# Altium schematic sheet Laser_System.SchDoc
size A4; Date: *******; ApprovedBy: *******; CheckedBy: None; Author: *******; CompanyName: *******; DrawnBy: Name; Engineer: *******; Organization: *******; Address1: *******; Address2: *******; Address3: *******; Address4: *******; DocumentNumber: Doc Num; Revision: *******; SheetNumber: 7; SheetTotal: 7; CurrentTime: *******; CurrentDate: *******; Time: *******; DocumentFullPathAndName: *******; DocumentName: *******; ModifiedDate: *******; ImagePath: *******; ProjectName: *******; Application_BuildNumber: *******
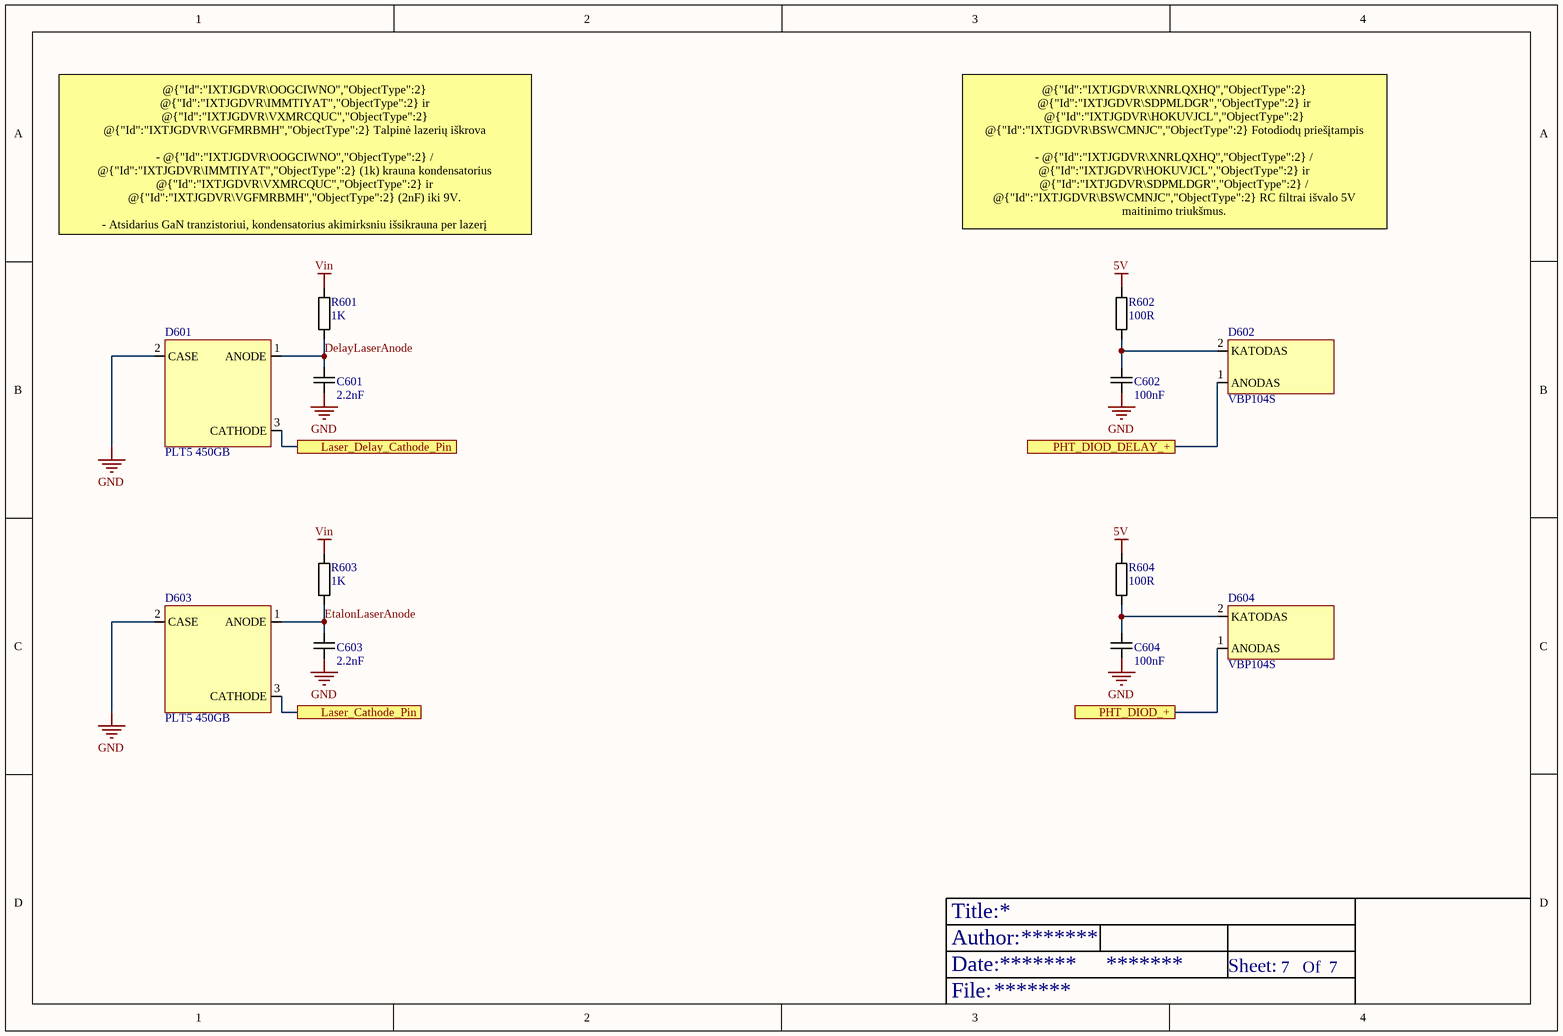
[diagram p0: Laser_System.SchDoc]

## Parts
C601  2.2nF  [2.2nF 0603]
C602  100nF  [100nF 0402]
C603  2.2nF  [2.2nF 0603]
C604  100nF  [100nF 0402]
D601  PLT5 450GB  [PLT5 450GB]
D602  VBP104S  [VBP104S]
D603  PLT5 450GB  [PLT5 450GB]
D604  VBP104S  [VBP104S]
R601  1K  [1k 0603]
R602  100R  [100R 0402]
R603  1K  [1k 0603]
R604  100R  [100R 0402]

## Ports
Laser_Cathode_Pin (see Laser_Driver[2C]), Laser_Delay_Cathode_Pin (see Laser_Driver[2B]), PHT_DIOD_+ (see Light_Detection[2C]), PHT_DIOD_DELAY_+ (see Light_Detection[2B])

## Nets
5V: R602.1 R604.2
GND: C601.1 C602.1 C603.1 C604.1 D601.2(CASE) D603.2(CASE)
Vin: R601.2 R603.2
DelayLaserAnode: C601.2 D601.1(ANODE) R601.1
EtalonLaserAnode: C603.2 D603.1(ANODE) R603.1
Laser_Cathode_Pin: D603.3(CATHODE) ; port Laser_Cathode_Pin
Laser_Delay_Cathode_Pin: D601.3(CATHODE) ; port Laser_Delay_Cathode_Pin
PHT_DIOD_+: D604.1(ANODAS) ; port PHT_DIOD_+
PHT_DIOD_DELAY_+: D602.1(ANODAS) ; port PHT_DIOD_DELAY_+
NetC602_2: C602.2 D602.2(KATODAS) R602.2
NetC604_2: C604.2 D604.2(KATODAS) R604.1

## Notes on the sheet
- @{"Id":"IXTJGDVR\OOGCIWNO","ObjectType":2} @{"Id":"IXTJGDVR\IMMTIYAT","ObjectType":2} ir @{"Id":"IXTJGDVR\VXMRCQUC","ObjectType":2} @{"Id":"IXTJGDVR\VGFMRBMH","ObjectType":2} Talpinė lazerių iškrova
  - @{"Id":"IXTJGDVR\OOGCIWNO","ObjectType":2} / @{"Id":"IXTJGDVR\IMMTIYAT","ObjectType":2} (1k) krauna kondensatorius @{"Id":"IXTJGDVR\VXMRCQUC","ObjectType":2} ir @{"Id":"IXTJGDVR\VGFMRBMH","ObjectType":2} (2nF) iki 9V.
  - Atsidarius GaN tranzistoriui, kondensatorius akimirksniu išsikrauna per lazerį
  ( @{"Id":"IXTJGDVR\VURCQILD","ObjectType":2} / @{"Id":"IXTJGDVR\NUGRJXVH","ObjectType":2} ) į žemę ir duoda aštrų sub-ns šviesos impulsą.
  - Kondensatoriui išsikrovus lazeris užgęsta pats, o 1k varža apsaugo jį nuo sudegimo.
- @{"Id":"IXTJGDVR\XNRLQXHQ","ObjectType":2} @{"Id":"IXTJGDVR\SDPMLDGR","ObjectType":2} ir @{"Id":"IXTJGDVR\HOKUVJCL","ObjectType":2} @{"Id":"IXTJGDVR\BSWCMNJC","ObjectType":2} Fotodiodų priešįtampis
  - @{"Id":"IXTJGDVR\XNRLQXHQ","ObjectType":2} / @{"Id":"IXTJGDVR\HOKUVJCL","ObjectType":2} ir @{"Id":"IXTJGDVR\SDPMLDGR","ObjectType":2} / @{"Id":"IXTJGDVR\BSWCMNJC","ObjectType":2} RC filtrai išvalo 5V maitinimo triukšmus.
  - Katodai pajungti prie 5V, o Anodai per OPA855 (@{"Id":"EQXASDVB\NMYZCVUP","ObjectType":2} ir @{"Id":"EQXASDVB\IJIHGKBT","ObjectType":2}) sėdi ties 3.3V
  (1.7V atbulinis priešįtampis maksimaliai sumažina diodo talpą ir padidina greitį).
  - Šviesos blyksnio srovė siunčiama tiesiai į OPA855 stiprintuvą.
- Title:
- Date:
- Author:
- Sheet:
- Of
- File:

## Library data of the parts
C601 C603 = 2.2nF 0603: C0603X222K1REC7411
C602 C604 = 100n 0402: C1005X7R1E104K050BB
D601 D603 = PLT5 450GB: Lazeris
D602 D604 = VBP104S: FotoDiodas
R601 R603 = 1K 0603: ERA-3AEB102V
R602 R604 = 100R 0402: ERA-2VEB1000X